# Altium project tracker-pro-airbnb-v1.0.PrjPcb (part 1 of 6)
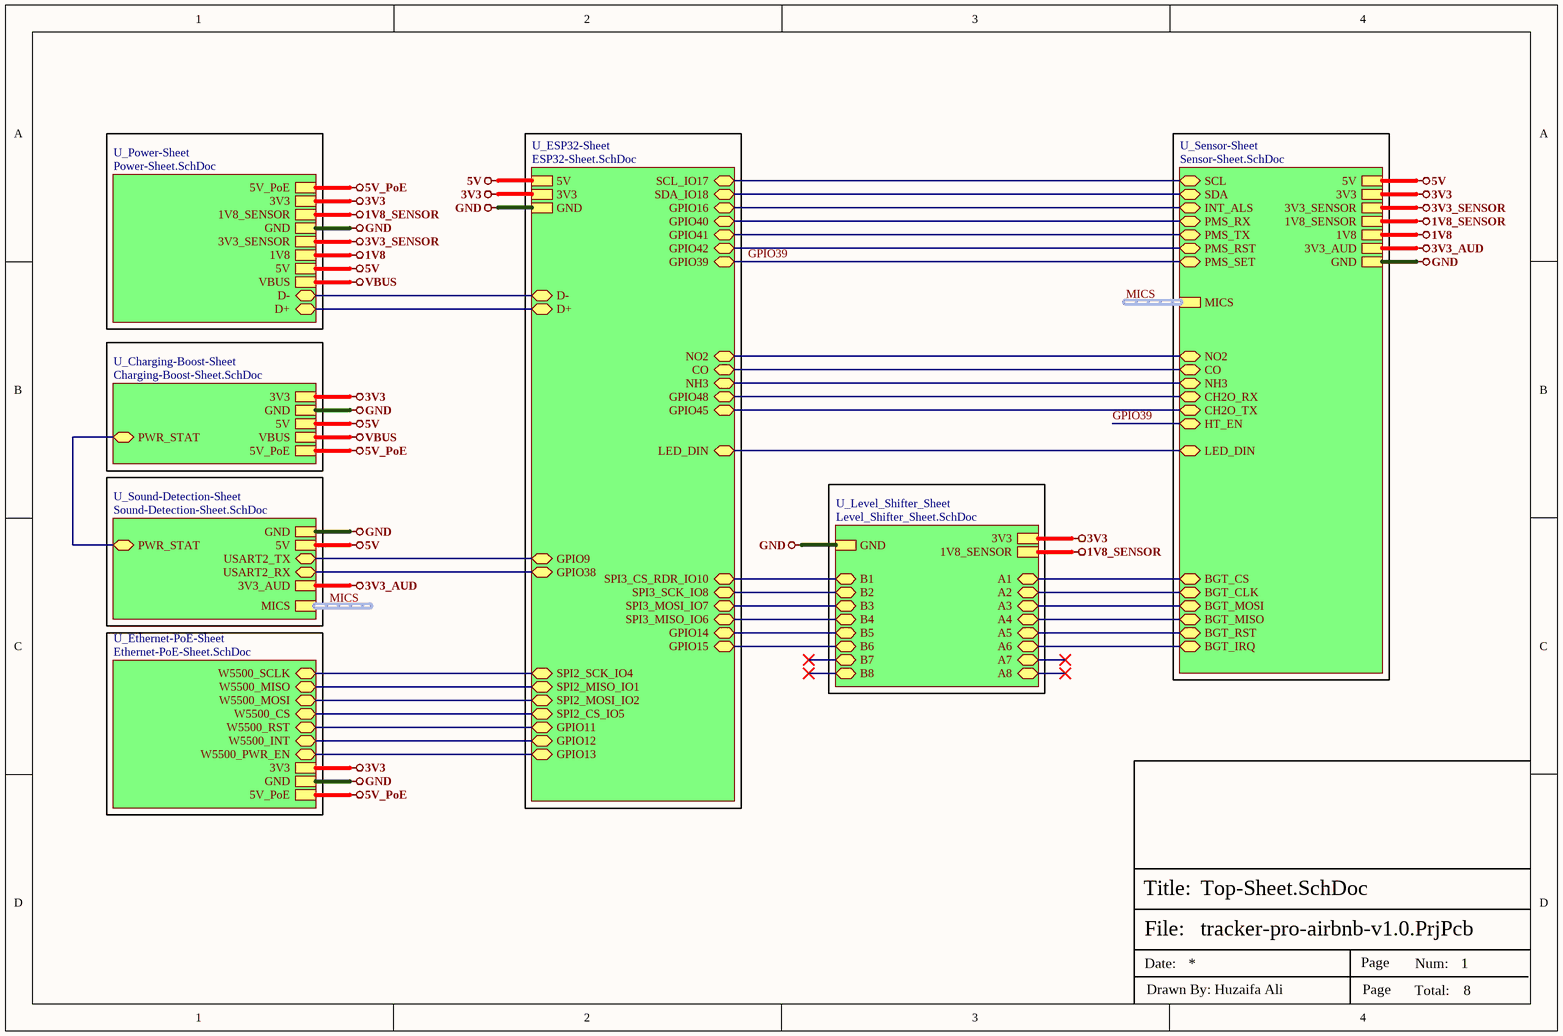
[diagram p0: Top-Sheet.SchDoc]
8 sheets, 240 parts. Net scope: hierarchical (ports join the sheet entries above them; power ports are global).
Board file: AirBnB-v1.0.PcbDoc
Sheets:
  Top-Sheet.SchDoc
    U_Power-Sheet = Power-Sheet.SchDoc
    U_Charging-Boost-Sheet = Charging-Boost-Sheet.SchDoc
    U_Sensor-Sheet = Sensor-Sheet.SchDoc
    U_Level_Shifter_Sheet = Level_Shifter_Sheet.SchDoc
    U_ESP32-Sheet = ESP32-Sheet.SchDoc
    U_Ethernet-PoE-Sheet = Ethernet-PoE-Sheet.SchDoc
    U_Sound-Detection-Sheet = Sound-Detection-Sheet.SchDoc

## Sheet Top-Sheet.SchDoc
size A4; SheetNumber: 1; SheetTotal: 8

### Sub-sheets
U_Charging-Boost-Sheet = Charging-Boost-Sheet.SchDoc: 3V3, GND, 5V, VBUS, 5V_PoE, PWR_STAT (bidir)
U_ESP32-Sheet = ESP32-Sheet.SchDoc: SDA_IO18 (bidir), SCL_IO17 (bidir), D- (bidir), D+ (bidir), NO2 (bidir), CO (bidir), NH3 (bidir), GPIO39 (bidir), GPIO40 (bidir), GPIO41 (bidir), GPIO42 (bidir), GPIO14 (bidir), GPIO15 (bidir), GPIO16 (bidir), SPI3_MISO_IO6 (bidir), SPI3_MOSI_IO7 (bidir), SPI3_SCK_IO8 (bidir), SPI3_CS_RDR_IO10 (bidir), GPIO11 (bidir), GPIO12 (bidir), GPIO13 (bidir), SPI2_CS_IO5 (bidir), SPI2_SCK_IO4 (bidir), 3V3, GND, 5V, GPIO9 (bidir), SPI2_MISO_IO1 (bidir), SPI2_MOSI_IO2 (bidir), GPIO38 (bidir), GPIO45 (bidir), GPIO48 (bidir), LED_DIN (bidir)
U_Ethernet-PoE-Sheet = Ethernet-PoE-Sheet.SchDoc: W5500_SCLK (bidir), W5500_MISO (bidir), W5500_MOSI (bidir), W5500_RST (bidir), W5500_INT (bidir), W5500_CS (bidir), W5500_PWR_EN (bidir), 3V3, GND, 5V_PoE
U_Level_Shifter_Sheet = Level_Shifter_Sheet.SchDoc: 3V3, 1V8_SENSOR, GND, A1 (bidir), A2 (bidir), A3 (bidir), A4 (bidir), A5 (bidir), A6 (bidir), A7 (bidir), A8 (bidir), B1 (bidir), B2 (bidir), B3 (bidir), B4 (bidir), B5 (bidir), B6 (bidir), B7 (bidir), B8 (bidir)
U_Power-Sheet = Power-Sheet.SchDoc: 3V3, 1V8_SENSOR, GND, 3V3_SENSOR, 1V8, 5V, VBUS, D- (bidir), D+ (bidir), 5V_PoE
U_Sensor-Sheet = Sensor-Sheet.SchDoc: SDA (bidir), SCL (bidir), BGT_CS (bidir), BGT_CLK (bidir), BGT_MOSI (bidir), BGT_RST (bidir), BGT_IRQ (bidir), BGT_MISO (bidir), PMS_SET (bidir), PMS_RX (bidir), PMS_TX (bidir), PMS_RST (bidir), INT_ALS (bidir), NO2 (bidir), CO (bidir), NH3 (bidir), CH2O_RX (bidir), CH2O_TX (bidir), 3V3, 1V8_SENSOR, GND, 3V3_SENSOR, 1V8, 5V, HT_EN (bidir), MICS (harness MICS), 3V3_AUD, LED_DIN (bidir)
U_Sound-Detection-Sheet = Sound-Detection-Sheet.SchDoc: GND, 5V, USART2_TX (bidir), USART2_RX (bidir), PWR_STAT (bidir), 3V3_AUD, MICS (harness MICS)

### Nets
1V8: sheet U_Power-Sheet/1V8, sheet U_Sensor-Sheet/1V8
1V8_SENSOR: sheet U_Power-Sheet/1V8_SENSOR, sheet U_Sensor-Sheet/1V8_SENSOR, sheet U_Level_Shifter_Sheet/1V8_SENSOR
3V3: sheet U_Power-Sheet/3V3, sheet U_Charging-Boost-Sheet/3V3, sheet U_Sensor-Sheet/3V3, sheet U_Level_Shifter_Sheet/3V3, sheet U_ESP32-Sheet/3V3, sheet U_Ethernet-PoE-Sheet/3V3
3V3_AUD: sheet U_Sensor-Sheet/3V3_AUD, sheet U_Sound-Detection-Sheet/3V3_AUD
3V3_SENSOR: sheet U_Power-Sheet/3V3_SENSOR, sheet U_Sensor-Sheet/3V3_SENSOR
5V: sheet U_Power-Sheet/5V, sheet U_Charging-Boost-Sheet/5V, sheet U_Sensor-Sheet/5V, sheet U_ESP32-Sheet/5V, sheet U_Sound-Detection-Sheet/5V
5V_PoE: sheet U_Power-Sheet/5V_PoE, sheet U_Charging-Boost-Sheet/5V_PoE, sheet U_Ethernet-PoE-Sheet/5V_PoE
GND: sheet U_Power-Sheet/GND, sheet U_Charging-Boost-Sheet/GND, sheet U_Sensor-Sheet/GND, sheet U_Level_Shifter_Sheet/GND, sheet U_ESP32-Sheet/GND, sheet U_Ethernet-PoE-Sheet/GND, sheet U_Sound-Detection-Sheet/GND
VBUS: sheet U_Power-Sheet/VBUS, sheet U_Charging-Boost-Sheet/VBUS
W5500_RST: sheet U_ESP32-Sheet/GPIO11, sheet U_Ethernet-PoE-Sheet/W5500_RST
A1: sheet U_Sensor-Sheet/BGT_CS, sheet U_Level_Shifter_Sheet/A1
A2: sheet U_Sensor-Sheet/BGT_CLK, sheet U_Level_Shifter_Sheet/A2
A3: sheet U_Sensor-Sheet/BGT_MOSI, sheet U_Level_Shifter_Sheet/A3
A4: sheet U_Sensor-Sheet/BGT_MISO, sheet U_Level_Shifter_Sheet/A4
A5: sheet U_Sensor-Sheet/BGT_RST, sheet U_Level_Shifter_Sheet/A5
A6: sheet U_Sensor-Sheet/BGT_IRQ, sheet U_Level_Shifter_Sheet/A6
B1: sheet U_Level_Shifter_Sheet/B1, sheet U_ESP32-Sheet/SPI3_CS_RDR_IO10
B2: sheet U_Level_Shifter_Sheet/B2, sheet U_ESP32-Sheet/SPI3_SCK_IO8
B3: sheet U_Level_Shifter_Sheet/B3, sheet U_ESP32-Sheet/SPI3_MOSI_IO7
B4: sheet U_Level_Shifter_Sheet/B4, sheet U_ESP32-Sheet/SPI3_MISO_IO6
B5: sheet U_Level_Shifter_Sheet/B5, sheet U_ESP32-Sheet/GPIO14
B6: sheet U_Level_Shifter_Sheet/B6, sheet U_ESP32-Sheet/GPIO15
CH2O_RX: sheet U_Sensor-Sheet/CH2O_RX, sheet U_ESP32-Sheet/GPIO48
CH2O_TX: sheet U_Sensor-Sheet/CH2O_TX, sheet U_ESP32-Sheet/GPIO45
CO: sheet U_Sensor-Sheet/CO, sheet U_ESP32-Sheet/CO
GPIO9: sheet U_ESP32-Sheet/GPIO9, sheet U_Sound-Detection-Sheet/USART2_TX
GPIO12: sheet U_ESP32-Sheet/GPIO12, sheet U_Ethernet-PoE-Sheet/W5500_INT
GPIO13: sheet U_ESP32-Sheet/GPIO13, sheet U_Ethernet-PoE-Sheet/W5500_PWR_EN
GPIO16: sheet U_Sensor-Sheet/INT_ALS, sheet U_ESP32-Sheet/GPIO16
GPIO38: sheet U_ESP32-Sheet/GPIO38, sheet U_Sound-Detection-Sheet/USART2_RX
GPIO39: sheet U_Sensor-Sheet/PMS_SET, sheet U_Sensor-Sheet/HT_EN, sheet U_ESP32-Sheet/GPIO39
GPIO40: sheet U_Sensor-Sheet/PMS_RX, sheet U_ESP32-Sheet/GPIO40
GPIO41: sheet U_Sensor-Sheet/PMS_TX, sheet U_ESP32-Sheet/GPIO41
GPIO42: sheet U_Sensor-Sheet/PMS_RST, sheet U_ESP32-Sheet/GPIO42
LED_DIN: sheet U_Sensor-Sheet/LED_DIN, sheet U_ESP32-Sheet/LED_DIN
NH3: sheet U_Sensor-Sheet/NH3, sheet U_ESP32-Sheet/NH3
NO2: sheet U_Sensor-Sheet/NO2, sheet U_ESP32-Sheet/NO2
PWR_STAT: sheet U_Charging-Boost-Sheet/PWR_STAT, sheet U_Sound-Detection-Sheet/PWR_STAT
SCL: sheet U_Sensor-Sheet/SCL, sheet U_ESP32-Sheet/SCL_IO17
SDA: sheet U_Sensor-Sheet/SDA, sheet U_ESP32-Sheet/SDA_IO18
SPI2_CS_IO5: sheet U_ESP32-Sheet/SPI2_CS_IO5, sheet U_Ethernet-PoE-Sheet/W5500_CS
SPI2_MISO_IO1: sheet U_ESP32-Sheet/SPI2_MISO_IO1, sheet U_Ethernet-PoE-Sheet/W5500_MISO
SPI2_MOSI_IO2: sheet U_ESP32-Sheet/SPI2_MOSI_IO2, sheet U_Ethernet-PoE-Sheet/W5500_MOSI
SPI2_SCK_IO4: sheet U_ESP32-Sheet/SPI2_SCK_IO4, sheet U_Ethernet-PoE-Sheet/W5500_SCLK
USB_N: sheet U_Power-Sheet/D-, sheet U_ESP32-Sheet/D-
USB_P: sheet U_Power-Sheet/D+, sheet U_ESP32-Sheet/D+

### Buses and harness runs
harness MICS = sheet U_Sensor-Sheet/MICS
harness MICS = sheet U_Sound-Detection-Sheet/MICS

### Notes on the sheet
- File:
- Title:
- Date:
- Page
- Num:
- Total:
- Drawn By: Huzaifa Ali

## Sheet Power-Sheet.SchDoc
size A4; SheetNumber: 2; SheetTotal: 8
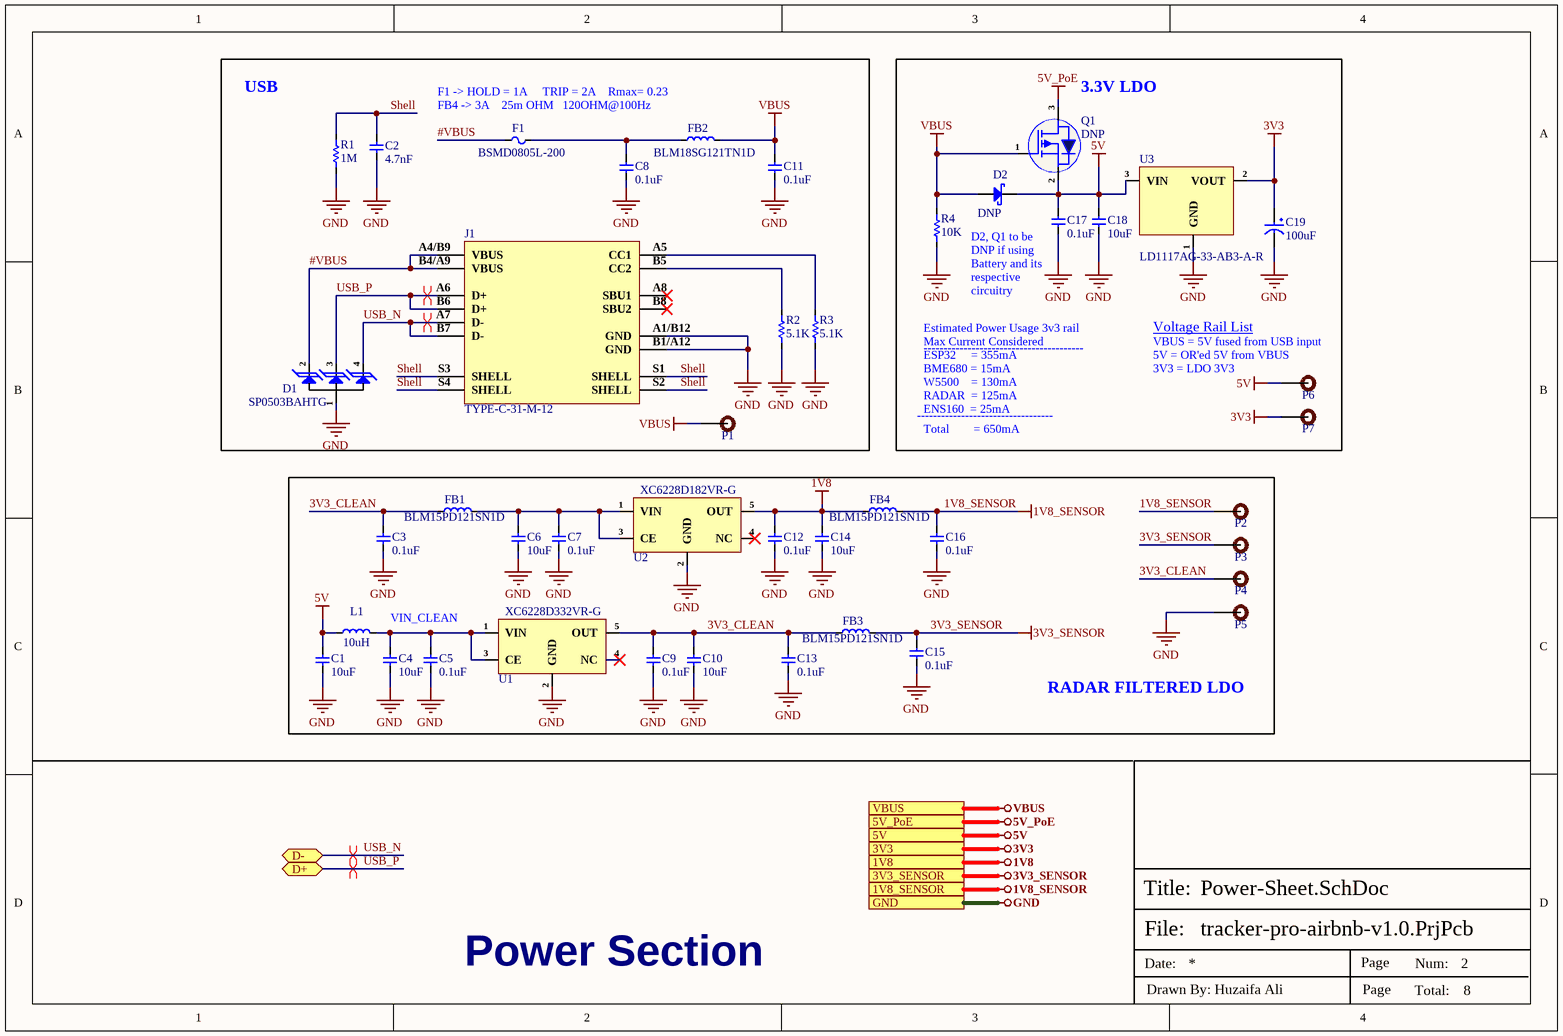
[diagram p1: Power-Sheet.SchDoc]

### Parts
C1  10uF  [Cap-0402]
C2  4.7nF  [Cap-1206]
C3  0.1uF  [Cap-0402]
C4  10uF  [Cap-0402]
C5  0.1uF  [Cap-0402]
C6  10uF  [Cap-0402]
C7  0.1uF  [Cap-0402]
C8  0.1uF  [Cap-0402]
C9  0.1uF  [Cap-0402]
C10  10uF  [Cap-0402]
C11  0.1uF  [Cap-0402]
C12  0.1uF  [Cap-0402]
C13  0.1uF  [Cap-0402]
C14  10uF  [Cap-0402]
C15  0.1uF  [Cap-0402]
C16  0.1uF  [Cap-0402]
C17  0.1uF  [Cap-0402]
C18  10uF  [Cap-0402]
C19  100uF  [Case-B]
D1  SP0503BAHTG  [SOT-143-4_]
D2  DNP  [SOD-123FL]
F1  BSMD0805L-200  [Fuse-0805]
FB1  BLM15PD121SN1D  [IND-0402]
FB2  BLM18SG121TN1D  [IND-0603 (1608 Metric)]
FB3  BLM15PD121SN1D  [IND-0402]
FB4  BLM15PD121SN1D  [IND-0402]
J1  TYPE-C-31-M-12  [TYPE-C-31-M-12_]
L1  10uH  [IND-1008 (2520 Metric)]
P1  TEST POINT  [Test-point]  (value not drawn)
P2  TEST POINT  [Test-point]  (value not drawn)
P3  TEST POINT  [Test-point]  (value not drawn)
P4  TEST POINT  [Test-point]  (value not drawn)
P5  TEST POINT  [Test-point]  (value not drawn)
P6  TEST POINT  [Test-point]  (value not drawn)
P7  TEST POINT  [Test-point]  (value not drawn)
Q1  DNP  [SOT-23]
R1  1M  [Res-0603]
R2  5.1K  [Res-0402]
R3  5.1K  [Res-0402]
R4  10K  [Res-0402]
U1  XC6228D332VR-G  [SOT-25-5]
U2  XC6228D182VR-G  [SOT-25-5]
U3  LD1117AG-33-AB3-A-R  [SOT-89-3]

### Blocks framed on the sheet
USB: C2 C8 C11 D1 F1 FB2 J1 P1 R1-R3
3.3V LDO: C17-C19 D2 P6 P7 Q1 R4 U3
RADAR FILTERED LDO: C1 C3-C7 C9 C10 C12-C16 FB1 FB3 FB4 L1 P2-P5 U1 U2

### Ports
1V8, 1V8_SENSOR, 3V3, 3V3_SENSOR, 5V, 5V_PoE, D+ (bidir), D- (bidir), GND, VBUS

### Nets
1V8: C12.2 C14.2 FB4.1 U2.5(OUT) ; port 1V8
1V8_SENSOR: C16.2 FB4.2 P2.1 ; port 1V8_SENSOR
3V3: C19.1 P7.1 U3.2(VOUT) ; port 3V3
3V3_SENSOR: C15.2 FB3.2 P3.1 ; port 3V3_SENSOR
5V: C1.2 C17.2 C18.2 D2.1(K) L1.1 P6.1 Q1.2(S) U3.3(VIN) ; port 5V
5V_PoE: Q1.3(D) ; port 5V_PoE
GND: C1.1 C2.1 C3.1 C4.1 C5.1 C6.1 C7.1 C8.1 C9.1 C10.1 C11.1 C12.1 C13.1 C14.1 C15.1 C16.1 C17.1 C18.1 C19.2 D1.1(A) J1.A1/B12(GND) J1.B1/A12(GND) P5.1 R1.1 R2.1 R3.1 R4.2 U1.2(GND) U2.2(GND) U3.1(GND) ; port GND
VBUS: C11.2 D2.2(A) FB2.2 P1.1 Q1.1(G) R4.1 ; port VBUS
3V3_CLEAN: C3.2 C9.2 C10.2 C13.2 FB1.1 FB3.1 P4.1 U1.5(OUT)
#VBUS: D1.2(K) F1.1 J1.A4/B9(VBUS) J1.B4/A9(VBUS)
Shell: C2.2 J1.S1(SHELL) J1.S2(SHELL) J1.S3(SHELL) J1.S4(SHELL) R1.2
USB_N: D1.4(K) J1.A7(D-) J1.B7(D-) ; port D-
USB_P: D1.3(K) J1.A6(D+) J1.B6(D+) ; port D+
NetC4_2: C4.2 C5.2 L1.2 U1.1(VIN) U1.3(CE)
NetC6_2: C6.2 C7.2 FB1.2 U2.1(VIN) U2.3(CE)
NetC8_2: C8.2 F1.2 FB2.1
NetJ1_A5: J1.A5(CC1) R3.2
NetJ1_B5: J1.B5(CC2) R2.2

Not connected (* = marked no-connect by the designer): J1 A8(SBU1)* B8(SBU2)*; U1 4(NC)*; U2 4(NC)*

### Layout directives
differential pair; net class USB; differential pair class USB_Lines; rule Impedance Constraint [Min = 87.00    Max = 92.00    ]; rule Matched Net Lengths [Tolerance = 0.508mm]: USB_N, USB_P

### Notes on the sheet
- F1 -> HOLD = 1A     TRIP = 2A    Rmax= 0.23
- (near F1) FB4 -> 3A    25m OHM   120OHM@100Hz
- (near C17) D2, Q1 to be DNP if using Battery and its respective circuitry
- Estimated Power Usage 3v3 rail
- Max Current Considered
- ----------------------------------------
- ESP32     = 355mA
- BME680 = 15mA
- W5500    = 130mA
- Voltage Rail List
- (near P6) VBUS = 5V fused from USB input
- (near P6) 5V = OR'ed 5V from VBUS
- 3V3 = LDO 3V3
- ----------------------------------
- RADAR  = 125mA
- Total        = 650mA
- ENS160  = 25mA
- VIN_CLEAN
- Power Section
- File:
- Title:
- Date:
- Page
- Num:
- Total:
- Drawn By: Huzaifa Ali

### Library data of the parts
C1 C4 C6 C10 C14 C18 = CC0402MRX5R6BB106: CAP CER 10UF 10V X5R 0402; Manufacturer: Yageo; Tolerance: 20%; Item Type: Capacitor; Supplier 1: Future Electronics; Manufacturer Part Number: CC0402MRX5R6BB106; RoHS: Yes; Category: Ceramic Capacitors; Stock 1: 80000; Pricing 1: 10000=0.02650, 20000=0.02590, 30000=0.02550, 40000=0.02530, 50000=0.02450 (USD); Mount: Surface Mount; Case/Package: 0402; Case Code (Imperial): 0402; Case Code (Metric): 1005; Min Operating Temperature: -55°C; Max Operating Temperature: 85°C; Packaging: Tape and Reel; Capacitance: 10uF; Voltage Rating: 10V; RoHS Compliant: Yes; ComponentLink1URL: http://www.yageo.com/documents/recent/UPY-GPHC_X5R_4V-to-50V_25.pdf?src-supplier=Digi-Key; ComponentLink1Description: http://www.yageo.com/documents/recent/UPY-GPHC_X5R_4V-to-50V_25.pdf?src-supplier=Digi-Key; Supplier Part Number 1: 6097631; LCSC Part Number: C962143
C2 = CC1206KKX7RCBB472: CAP CER 4700PF 1KV X7R 1206; Manufacturer: Yageo; Dielectric Material: Ceramic; Tolerance: 10%; Item Type: Capacitor; Supplier 1: Future Electronics; Manufacturer Part Number: CC1206KKX7RCBB472; RoHS: Yes; Category: Ceramic Capacitors; Stock 1: 180000; Pricing 1: 3000=0.02860, 9000=0.02750, 15000=0.02700, 45000=0.02600, 75000=0.02510 (USD); Mount: Surface Mount; Case/Package: 1206; Number of Pins: 2; Case Code (Imperial): 1206; Case Code (Metric): 3216; Weight: 0.000571oz; Min Operating Temperature: -55°C; Max Operating Temperature: 125°C; Voltage Rating: 1kV; Capacitance: 4.7nF; Packaging: Tape and Reel; Voltage Rating (DC): 1kV; Dielectric: X7R; Termination: SMD/SMT; Resistor Type: Ceramic; Series: CC; Length: 3.2mm; Width: 0.063inch; Thickness: 0.057inch; Depth: 1.6mm; Radiation Hardening: No; Lead Free: Lead Free; RoHS Compliant: Yes; ComponentLink1URL: https://datasheet.ciiva.com/13208/upy-gp-np0-16v-to-50v-8-13208693.pdf?src-supplier=Mouser; ComponentLink1Description: https://datasheet.ciiva.com/13208/upy-gp-np0-16v-to-50v-8-13208693.pdf?src-supplier=Mouser; ComponentLink2URL: https://datasheet.ciiva.com/11466/hv-11466701.pdf?src-supplier=Avnet; ComponentLink2Description: https://datasheet.ciiva.com/11466/hv-11466701.pdf?src-supplier=Avnet; Supplier Part Number 1: 7130131; LCSC Part Number: C107198
C3 C5 C7-C9 C11-C13 C15-C17 = C1005X5R1H104K050BB: CAP CER 0.1UF 50V X5R 0402; Manufacturer: TDK; Dielectric Material: Ceramic; Capacitance: 100nF; Tolerance: 10%; Supplier 1: Digi-Key; Manufacturer Part Number: C1005X5R1H104K050BB; Stock 1: 1455182; Pricing 1: 1=0.12, 10=0.09, 50=0.049, 100=0.04, 500=0.02858, 1000=0.02245, 2500=0.02041, 5000=0.01878 (USD); Mount: Surface Mount; Case/Package: 0402; Case Code (Metric): 1005; Case Code (Imperial): 0402; Weight: 2.3E-05oz; Min Operating Temperature: -55°C; Max Operating Temperature: 85°C; Dielectric: X5R; Voltage Rating: 50V; Packaging: Tape and Reel; Voltage Rating (DC): 50V; Termination: SMD/SMT; Construction: Flat; Package Quantity: 1; Resistor Type: Ceramic; Voltage: 50V; Series: C; Length: 1mm; Width: 0.02inch; Height: 0.5mm; Depth: 0.5mm; Thickness: 0.022inch; Radiation Hardening: No; Lead Free: Lead Free; REACH SVHC: No SVHC; RoHS Compliant: Yes; ComponentLink1URL: https://product.tdk.com/info/en/catalog/spec/mlccspec_commercial_general_midvoltage_en.pdf?src-supplier=Digi-Key; ComponentLink1Description: https://product.tdk.com/info/en/catalog/spec/mlccspec_commercial_general_midvoltage_en.pdf?src-supplier=Digi-Key; ComponentLink2URL: http://www.tdk.co.jp/tefe02/e413_c.pdf?src-supplier=Future+Electronics; ComponentLink2Description: http://www.tdk.co.jp/tefe02/e413_c.pdf?src-supplier=Future+Electronics; ComponentLink3URL: https://www.verical.com/server-webapp/html/getDatasheet?partID=743571&src-supplier=Verical; ComponentLink3Description: https://www.verical.com/server-webapp/html/getDatasheet?partID=743571&src-supplier=Verical; ComponentLink4URL: http://www.tdk.co.jp/tefe02/e412_c.pdf?src-supplier=Avnet+Europe; ComponentLink4Description: http://www.tdk.co.jp/tefe02/e412_c.pdf?src-supplier=Avnet+Europe; Supplier Part Number 1: 445-5942-1-ND; LCSC Part Number: C2181865
C19 = TAJB107M010RNJ: CAP TANT 100UF 20% 10V 1411; Manufacturer: Kyocera AVX; Dielectric Material: Tantalum; Tolerance: 10%; ESR (Equivalent Series Resistance): 1.4R; Leakage Current: 10uA; Dissipation Factor: 8%; Item Type: Capacitor; Supplier 1: Rs; Manufacturer Part Number: TAJB107M010RNJ; RoHS: Yes; Category: Tantalum Capacitors; Stock 1: 17520; Pricing 1: 2000=0.302 (GBP); Mounting Technology: Surface Mount; Case/Package: 1210; Case Code (Imperial): 1210; Case Code (Metric): 3528; Min Operating Temperature: -55°C; Max Operating Temperature: 125°C; Value: 100uF; Voltage Rating (DC): 10V; Series: TAJ; Construction: Flat; Voltage Rating: 10V; Package Quantity: 2000; Packaging: Tape and Reel; Termination: SMD/SMT; Voltage: 10V; Features: General Purpose; Length: 3.5mm; Width: 2.8mm; Height: 2.1mm; Depth: 2.8mm; Radiation Hardening: No; Lead Free: Lead Free; RoHS Compliant: Yes; Reach SVHC Compliant: No; ComponentLink1URL: https://datasheet.ciiva.com/264/taj-264281.pdf?src-supplier=Digi-Key; ComponentLink1Description: https://datasheet.ciiva.com/264/taj-264281.pdf?src-supplier=Digi-Key; ComponentLink2URL: https://datasheet.ciiva.com/264/taj-264280.pdf?src-supplier=Digi-Key; ComponentLink2Description: https://datasheet.ciiva.com/264/taj-264280.pdf?src-supplier=Digi-Key; ComponentLink3URL: https://datasheet.ciiva.com/264/taj-264282.pdf?src-supplier=Digi-Key; ComponentLink3Description: https://datasheet.ciiva.com/264/taj-264282.pdf?src-supplier=Digi-Key; ComponentLink4URL: https://datasheet.ciiva.com/11225/taj-11225964.pdf?src-supplier=Avnet; ComponentLink4Description: https://datasheet.ciiva.com/11225/taj-11225964.pdf?src-supplier=Avnet; ComponentLink5URL: https://datasheet.ciiva.com/11225/taj-11225963.pdf?src-supplier=Avnet; ComponentLink5Description: https://datasheet.ciiva.com/11225/taj-11225963.pdf?src-supplier=Avnet; Supplier Part Number 1: 1354069; LCSC Part Number: C7196
D1 = SP0503BAHTG: ESD Suppressor TVS 5.5V 4-Pin(3+Tab) SOT-143 T/R; Manufacturer: Littelfuse; Element Configuration: Common Anode; Direction: Unidirectional; Capacitance: 30pF; Number of Channels: 3; Clamping Voltage: 7.8V; Power Line Protection: No; Polarity: Bidirectional,Unidirectional; Max Power Dissipation: 225mW; ESD Protection: Yes; Max Reverse Leakage Current: 100nA; Voltage Rating (DC): 5V; Diode Type: Avalanche; Clamping Voltage-Max: 8V; Supplier 1: Digi-Key; Manufacturer Part Number: SP0503BAHTG; RoHS: Yes; Category: Diodes; Stock 1: 651; Pricing 1: 1=0.92000, 10=0.81200, 100=0.62260, 500=0.49214, 1000=0.39371 (USD); Mount: Surface Mount; Case/Package: SOT-143; Number of Pins: 4; Min Operating Temperature: -40°C; Max Operating Temperature: 85°C; Operating Supply Voltage: 5.5V; Packaging: Tape and Reel; Number of Unidirectional Channels: 3; Reverse Standoff Voltage: 5.5V; Breakdown Voltage: 5.5V; Termination: SMD/SMT; Working Voltage: 5.5V; Peak Pulse Power: 225mW; Leakage Current: 100nA; Number of Elements: 3; Power Dissipation: 225mW; Resistor Type: Zener; Series: SP05, SPA®; Length: 3.04mm; Width: 1.4mm; Height: 1.05mm; Depth: 1.4mm; Radiation Hardening: No; REACH SVHC: No SVHC; Lead Free: Lead Free; RoHS Compliant: Yes; ComponentLink1URL: https://datasheet.ciiva.com/15143/getdatasheetpartid-116020-15143550.pdf?src-supplier=Verical; ComponentLink1Description: https://datasheet.ciiva.com/15143/getdatasheetpartid-116020-15143550.pdf?src-supplier=Verical; ComponentLink2URL: https://datasheet.ciiva.com/332/sp05xxba-332550.pdf?src-supplier=Digi-Key; ComponentLink2Description: https://datasheet.ciiva.com/332/sp05xxba-332550.pdf?src-supplier=Digi-Key; ComponentLink3URL: https://datasheet.ciiva.com/8062/littefuse-spa-sp050x-8062422.pdf?src-supplier=Element14; ComponentLink3Description: https://datasheet.ciiva.com/8062/littefuse-spa-sp050x-8062422.pdf?src-supplier=Element14; ComponentLink4URL: https://datasheet.ciiva.com/22697/1911798-22697942.pdf?src-supplier=Element14; ComponentLink4Description: https://datasheet.ciiva.com/22697/1911798-22697942.pdf?src-supplier=Element14; ComponentLink5URL: https://datasheet.ciiva.com/332/sp05xxba-332551.pdf?src-supplier=Digi-Key; ComponentLink5Description: https://datasheet.ciiva.com/332/sp05xxba-332551.pdf?src-supplier=Digi-Key; ComponentLink6URL: https://datasheet.ciiva.com/16449/sp05xxba-16449463.pdf?src-supplier=Future+Electronics; ComponentLink6Description: https://datasheet.ciiva.com/16449/sp05xxba-16449463.pdf?src-supplier=Future+Electronics; ComponentLink7URL: https://datasheet.ciiva.com/332/sp05xxba-332552.pdf?src-supplier=Digi-Key; ComponentLink7Description: https://datasheet.ciiva.com/332/sp05xxba-332552.pdf?src-supplier=Digi-Key; ComponentLink8URL: https://datasheet.ciiva.com/4509/sp05x-leadfree-4509162.pdf?src-supplier=Mouser; ComponentLink8Description: https://datasheet.ciiva.com/4509/sp05x-leadfree-4509162.pdf?src-supplier=Mouser; ComponentLink9URL: https://datasheet.ciiva.com/7650/526672-7650894.pdf?src-supplier=Element14; ComponentLink9Description: https://datasheet.ciiva.com/7650/526672-7650894.pdf?src-supplier=Element14; Supplier Part Number 1: F2715CT-ND; LCSC Part Number: C3029025
D2 = PMEG4030ER: SOD-123FL Schottky Barrier Diodes (SBD) ROHS; Manufacturer: Shikues; Item Type: Diode; Manufacturer Part Number: PMEG4030ER; Package: SOD-123FL; LCSC Part Number: C5366303; ComponentLink1Description: LCSC; ComponentLink1URL: https://www.lcsc.com/product-detail/Schottky-Barrier-Diodes-SBD_Shikues-PMEG4030ER_C5366303.html
F1 = BSMD0805L-200: 6V 2A 50A 1W -40℃~+85℃ 4A 4mΩ 5s 45mΩ 0805 Resettable Fuses ROHS; Manufacturer: BHFUSE; Item Type: Fuse; Manufacturer Part Number: BSMD0805L-200; Package: 0805; LCSC Part Number: C2757931; ComponentLink1Description: LCSC; ComponentLink1URL: https://www.lcsc.com/product-detail/Resettable-Fuses_BHFUSE-BSMD0805L-200_C2757931.html
FB1 FB3 FB4 = BLM15PD121SN1D: FERRITE BEAD 120 OHM 0402 1LN; Manufacturer: Murata; Material: Steel,Ferrite; Tolerance: 25%; Impedance: 120R; Current Rating: 1.3A; Number of Lines: 1; DC Resistance (DCR): 90mR; Test Frequency: 100MHz; Supplier 1: Avnet; Manufacturer Part Number: BLM15PD121SN1D; RoHS: Yes; Category: Ferrite Beads and Chips; Stock 1: 300000; Pricing 1: 10000=0.03238, 20000=0.03063, 40000=0.02888, 60000=0.02713, 80000=0.02538, 100000=0.02363, 1000000=0.02188 (USD); Case/Package: 0402; Number of Pins: 2; Core Material: Ferrite; Case Code (Metric): 1005; Case Code (Imperial): 0402; Min Operating Temperature: -55°C; Max Operating Temperature: 125°C; Package Quantity: 1; Packaging: Tape and Reel; Max Current Rating: 1.3A; Termination: SMD/SMT; Max DC Current: 1.3A; DC Current: 1.3A; Number of Circuits: 1; Series: BLM15PD; DC Resistance-Max: 90mR; Length: 1mm; Width: 0.5mm; Height: 0.5mm; Depth: 0.55mm; Radiation Hardening: No; Reach SVHC Compliant: Yes; Military Standard: Not; Lead Free: Lead Free; RoHS Compliant: Yes; ComponentLink1URL: https://datasheet.ciiva.com/11800/0900766b811b5866-11800860.pdf?src-supplier=RSComponents; ComponentLink1Description: https://datasheet.ciiva.com/11800/0900766b811b5866-11800860.pdf?src-supplier=RSComponents; ComponentLink2URL: https://datasheet.ciiva.com/18093/getdatasheetpartid-195858-18093157.pdf?src-supplier=Verical; ComponentLink2Description: https://datasheet.ciiva.com/18093/getdatasheetpartid-195858-18093157.pdf?src-supplier=Verical; ComponentLink3URL: https://datasheet.ciiva.com/41425/001171686-da-01-en-chip-drossel0402-120r-1300ma-1-0x0-5mm-41425776.pdf?src-supplier=Conrad; ComponentLink3Description: https://datasheet.ciiva.com/41425/001171686-da-01-en-chip-drossel0402-120r-1300ma-1-0x0-5mm-41425776.pdf?src-supplier=Conrad; ComponentLink4URL: https://datasheet.ciiva.com/41449/001172205-da-01-en-drossel-0402-120r-11-0x0-5mm-10000st-41449495.pdf?src-supplier=Conrad; ComponentLink4Description: https://datasheet.ciiva.com/41449/001172205-da-01-en-drossel-0402-120r-11-0x0-5mm-10000st-41449495.pdf?src-supplier=Conrad; ComponentLink5URL: https://datasheet.ciiva.com/1012/l0110e-1012435.pdf?src-supplier=Digi-Key; ComponentLink5Description: https://datasheet.ciiva.com/1012/l0110e-1012435.pdf?src-supplier=Digi-Key; ComponentLink6URL: https://datasheet.ciiva.com/1012/l0110e-1012434.pdf?src-supplier=Digi-Key; ComponentLink6Description: https://datasheet.ciiva.com/1012/l0110e-1012434.pdf?src-supplier=Digi-Key; ComponentLink7URL: https://datasheet.ciiva.com/1012/l0110e-1012436.pdf?src-supplier=Digi-Key; ComponentLink7Description: https://datasheet.ciiva.com/1012/l0110e-1012436.pdf?src-supplier=Digi-Key; Supplier Part Number 1: BLM15PD121SN1D; LCSC Part Number: C76891; Item Type: Ferrite Bead
FB2 = BLM18SG121TN1D: FERRITE BEAD 120 OHM 0603 1LN; Manufacturer: Murata; Material: Steel,Ferrite; Tolerance: 25%; Impedance: 120R; DC Resistance (DCR): 25mR; Max DC Current: 3A; Number of Lines: 1; Test Frequency: 100MHz; Shielding: Unshielded; Supplier 1: Arrow Electronics; Manufacturer Part Number: BLM18SG121TN1D; RoHS: Yes; Category: Ferrite Beads and Chips; Stock 1: 82612; Pricing 1: 1=0.12640, 10=0.08350, 25=0.07210, 100=0.05150, 250=0.04730, 500=0.04110, 1000=0.03420, 3000=0.03360, 6000=0.03320, 15000=0.03270, 30000=0.03200, 75000=0.03150 (USD); Case/Package: 0603; Number of Pins: 2; Core Material: Ferrite; Case Code (Metric): 1608; Case Code (Imperial): 0603; Min Operating Temperature: -55°C; Max Operating Temperature: 125°C; Package Quantity: 1; Max Current Rating: 3A; Packaging: Tape and Reel; Current Rating: 3A; Termination: SMD/SMT; Frequency: 100MHz; Number of Circuits: 1; Series: BLM18S; DC Resistance-Max: 25mR; Length: 1.6mm; Width: 0.8mm; Height: 0.8mm; Depth: 0.8mm; Reach SVHC Compliant: Yes; Lead Free: Lead Free; RoHS Compliant: Yes; ComponentLink1URL: https://datasheet.ciiva.com/1012/l0110s0100blm18s-1012624.pdf?src-supplier=Digi-Key; ComponentLink1Description: https://datasheet.ciiva.com/1012/l0110s0100blm18s-1012624.pdf?src-supplier=Digi-Key; ComponentLink2URL: https://datasheet.ciiva.com/11799/0900766b811b5866-11799181.pdf?src-supplier=RSComponents; ComponentLink2Description: https://datasheet.ciiva.com/11799/0900766b811b5866-11799181.pdf?src-supplier=RSComponents; ComponentLink3URL: https://datasheet.ciiva.com/18093/getdatasheetpartid-295885-18093249.pdf?src-supplier=Verical; ComponentLink3Description: https://datasheet.ciiva.com/18093/getdatasheetpartid-295885-18093249.pdf?src-supplier=Verical; ComponentLink4URL: https://datasheet.ciiva.com/41449/001171723-da-01-en-chip-drossel0603-120r-3000ma-1-6x0-8mm-41449353.pdf?src-supplier=Conrad; ComponentLink4Description: https://datasheet.ciiva.com/41449/001171723-da-01-en-chip-drossel0603-120r-3000ma-1-6x0-8mm-41449353.pdf?src-supplier=Conrad; ComponentLink5URL: https://datasheet.ciiva.com/41449/001172312-da-01-en-drossel-0603-120r-1-6x0-8mm-10000st-41449675.pdf?src-supplier=Conrad; ComponentLink5Description: https://datasheet.ciiva.com/41449/001172312-da-01-en-drossel-0603-120r-1-6x0-8mm-10000st-41449675.pdf?src-supplier=Conrad; ComponentLink6URL: https://datasheet.ciiva.com/8021/5151-8021511.pdf?src-supplier=Element14; ComponentLink6Description: https://datasheet.ciiva.com/8021/5151-8021511.pdf?src-supplier=Element14; ComponentLink7URL: https://datasheet.ciiva.com/8021/5151-8021512.pdf?src-supplier=Element14; ComponentLink7Description: https://datasheet.ciiva.com/8021/5151-8021512.pdf?src-supplier=Element14; ComponentLink8URL: https://datasheet.ciiva.com/14122/blm-series-eng-tds-14122906.pdf?src-supplier=Distrelec; ComponentLink8Description: https://datasheet.ciiva.com/14122/blm-series-eng-tds-14122906.pdf?src-supplier=Distrelec; ComponentLink9URL: https://datasheet.ciiva.com/1012/l0110s0100blm18s-1012623.pdf?src-supplier=Digi-Key; ComponentLink9Description: https://datasheet.ciiva.com/1012/l0110s0100blm18s-1012623.pdf?src-supplier=Digi-Key; ComponentLink10URL: https://datasheet.ciiva.com/1012/l0110s0100blm18s-1012625.pdf?src-supplier=Digi-Key; ComponentLink10Description: https://datasheet.ciiva.com/1012/l0110s0100blm18s-1012625.pdf?src-supplier=Digi-Key; ComponentLink11URL: https://datasheet.ciiva.com/16395/l0110s0100blm18s-16395498.pdf?src-supplier=Future+Electronics; ComponentLink11Description: https://datasheet.ciiva.com/16395/l0110s0100blm18s-16395498.pdf?src-supplier=Future+Electronics; Supplier Part Number 1: BLM18SG121TN1D; LCSC Part Number: C113030; Item Type: Ferrite Bead
J1 = TYPE-C-31-M-12: 250mA 1 16 Female Type-C SMD USB Connectors ROHS; Manufacturer: Korean Hroparts Elec; ComponentLink1Description: LCSC; ComponentLink1URL: https://www.lcsc.com/product-detail/USB-Connectors_Korean-Hroparts-Elec-TYPE-C-31-M-12_C165948.html; Manufacturer Part Number: TYPE-C-31-M-12; Footprint: Custom; LCSC Part Number: C165948; Item Type: USB Connector
L1 = VLS252012HBX-100M-1: FIXED IND 10UH 1A 540 MOHM SMD; Manufacturer: TDK; Core Material: Metal; Saturation Current: 850mA; Shielding: Shielded; DC Resistance (DCR): 540mR; Test Frequency: 1MHz; Tolerance: 20%; Item Type: Inductor; Supplier 1: Arrow Electronics; Manufacturer Part Number: VLS252012HBX-100M-1; RoHS: Yes; Category: Fixed Inductors; Stock 1: 10000; Pricing 1: 2000=0.12770, 24000=0.12640 (USD); Mount: Surface Mount; Case/Package: 1008; Case Code (Metric): 2520; Case Code (Imperial): 1008; Min Operating Temperature: -40°C; Max Operating Temperature: 105°C; Packaging: Cut Tape; Resistor Type: Wirewound; Inductance: 10uH; Current Rating: 1A; RMS Current (Irms): 1A; Inductance Tolerance: 20%; Series: VLS-HBX-1; Length: 0.098inch; Width: 0.079inch; Height - Seated (Max): 0.047inch; Reach SVHC Compliant: Yes; RoHS Compliant: Yes; ComponentLink1URL: http://www.farnell.com/datasheets/1866267.pdf?src-supplier=Farnell; ComponentLink1Description: http://www.farnell.com/datasheets/1866267.pdf?src-supplier=Farnell; ComponentLink2URL: http://www.farnell.com/datasheets/2608160.pdf?src-supplier=Farnell; ComponentLink2Description: http://www.farnell.com/datasheets/2608160.pdf?src-supplier=Farnell; ComponentLink3URL: http://www.farnell.com/datasheets/2130011.pdf?src-supplier=Element14; ComponentLink3Description: http://www.farnell.com/datasheets/2130011.pdf?src-supplier=Element14; ComponentLink4URL: http://www.farnell.com/datasheets/1866267.pdf?src-supplier=Newark; ComponentLink4Description: http://www.farnell.com/datasheets/1866267.pdf?src-supplier=Newark; ComponentLink5URL: https://product.tdk.com/info/en/catalog/datasheets/inductor_commercial_power_vls252012hbx-1_en.pdf?src-supplier=Digi-Key; ComponentLink5Description: https://product.tdk.com/info/en/catalog/datasheets/inductor_commercial_power_vls252012hbx-1_en.pdf?src-supplier=Digi-Key; ComponentLink6URL: https://product.tdk.com/info/en/catalog/datasheets/inductor_commercial_power_vls252012hbx-1_en.pdf?ref_disty=digikey&src-supplier=Digi-Key; ComponentLink6Description: https://product.tdk.com/info/en/catalog/datasheets/inductor_commercial_power_vls252012hbx-1_en.pdf?ref_disty=digikey&src-supplier=Digi-Key; Supplier Part Number 1: VLS252012HBX-100M-1; LCSC Part Number: C88532
P1-P7 = TEST POINT: Test Point ON; Item Type: TEST POINT
Q1 = SI2323DS: SOT-23-3 MOSFETs ROHS; Manufacturer: TECH PUBLIC; Item Type: Mosfet; Manufacturer Part Number: SI2323DS; Package: SOT-23-3; LCSC Part Number: C5182044; ComponentLink1Description: LCSC; ComponentLink1URL: https://www.lcsc.com/product-detail/MOSFETs_TECH-PUBLIC-SI2323DS_C5182044.html
R1 = RC0603FR-071ML: RES SMD 1M OHM 1% 1/10W 0603; Manufacturer: Yageo; Voltage Rating: 50V; Resistance: 1MR; Power Rating: 100mW; Temperature Coefficient: 100ppm/°C; Supplier 1: Digi-Key; Manufacturer Part Number: RC0603FR-071ML; Stock 1: 3824601; Pricing 1: 1=0.1, 10=0.023, 100=0.0094, 1000=0.00421, 2500=0.00366 (USD); Case/Package: 0603; Number of Pins: 2; Case Code (Imperial): 0603; Case Code (Metric): 1608; Min Operating Temperature: -55°C; Max Operating Temperature: 155°C; Voltage Rating (DC): 50V; Tolerance: 1%; Packaging: Tape and Reel; Package Quantity: 5000; Termination: SMD/SMT; Composition: Thick Film; Military Standard: Not; Length: 1.6mm; Height: 0.45mm; Width: 0.8mm; Depth: 0.8mm; REACH SVHC: No SVHC; Lead Free: Lead Free; ComponentLink1URL: http://www.farnell.com/datasheets/2167052.pdf?src-supplier=Mouser; ComponentLink1Description: http://www.farnell.com/datasheets/2167052.pdf?src-supplier=Mouser; ComponentLink2URL: http://www.farnell.com/datasheets/2167052.pdf?src-supplier=Element14; ComponentLink2Description: http://www.farnell.com/datasheets/2167052.pdf?src-supplier=Element14; ComponentLink3URL: http://documents.rs-components.com/techlib://itc_doclist_GB.htm?stockno=5048956&src-supplier=RSComponents; ComponentLink3Description: http://documents.rs-components.com/techlib://itc_doclist_GB.htm?stockno=5048956&src-supplier=RSComponents; Supplier Part Number 1: 311-1.00MHRDKR-ND; LCSC Part Number: C105578
R2 R3 = RC0402FR-075K1L: RES 5.1K OHM 1% 1/16W 0402; Manufacturer: Yageo; Power Rating: 63mW; Resistance: 5.1kR; Temperature Coefficient: 100ppm/°C; Voltage Rating: 50V; Item Type: Resistor; Supplier 1: Avnet; Manufacturer Part Number: RC0402FR-075K1L; RoHS: Yes; Category: Chip SMD Resistors; Stock 1: 65000; Pricing 1: 10000=0.00085 (USD); Case/Package: 0402; Case Code (Metric): 1005; Case Code (Imperial): 0402; Min Operating Temperature: -55°C; Max Operating Temperature: 155°C; Tolerance: 1%; Technology: THICK FILM; Packaging: Tape and Reel; Package Quantity: 1; Resistor Type: Thick Film; Number of Terminations: 2; Termination: SMD/SMT; Max Power Dissipation: 63mW; Voltage Rating (DC): 50V; Working Voltage: 50V; Features: Moisture Resistant; Series: RC; Resistance Tolerance: 1%; Construction: Rectangular; Length: 1mm; Width: 0.02inch; Height: 0.016inch; Depth: 0.5mm; RoHS Compliant: Yes; Military Standard: Not; Lead Free: Lead Free; ComponentLink1URL: https://datasheet.ciiva.com/7983/1018594-7983519.pdf?src-supplier=Element14; ComponentLink1Description: https://datasheet.ciiva.com/7983/1018594-7983519.pdf?src-supplier=Element14; ComponentLink2URL: https://datasheet.ciiva.com/46394/1018594-46394936.pdf?src-supplier=Element14; ComponentLink2Description: https://datasheet.ciiva.com/46394/1018594-46394936.pdf?src-supplier=Element14; ComponentLink3URL: https://datasheet.ciiva.com/2453/pyu-r-int-thick-7-2453401.pdf?src-supplier=Digi-Key; ComponentLink3Description: https://datasheet.ciiva.com/2453/pyu-r-int-thick-7-2453401.pdf?src-supplier=Digi-Key; ComponentLink4URL: https://datasheet.ciiva.com/2453/pyu-r-int-thick-7-2453402.pdf?src-supplier=Digi-Key; ComponentLink4Description: https://datasheet.ciiva.com/2453/pyu-r-int-thick-7-2453402.pdf?src-supplier=Digi-Key; ComponentLink5URL: https://datasheet.ciiva.com/2453/pyu-r-int-thick-7-2453400.pdf?src-supplier=Digi-Key; ComponentLink5Description: https://datasheet.ciiva.com/2453/pyu-r-int-thick-7-2453400.pdf?src-supplier=Digi-Key; ComponentLink6URL: https://datasheet.ciiva.com/12558/pyu-rc0402-51-rohs-l-6-r-8721-12558460.pdf?src-supplier=Mouser; ComponentLink6Description: https://datasheet.ciiva.com/12558/pyu-rc0402-51-rohs-l-6-r-8721-12558460.pdf?src-supplier=Mouser; ComponentLink7URL: https://datasheet.ciiva.com/16744/pyu-rc0402-51-rohs-l-6-r-16744283.pdf?src-supplier=Future+Electronics; ComponentLink7Description: https://datasheet.ciiva.com/16744/pyu-rc0402-51-rohs-l-6-r-16744283.pdf?src-supplier=Future+Electronics; ComponentLink8URL: https://datasheet.ciiva.com/15189/getdatasheetpartid-323636-15189493.pdf?src-supplier=Verical; ComponentLink8Description: https://datasheet.ciiva.com/15189/getdatasheetpartid-323636-15189493.pdf?src-supplier=Verical; Supplier Part Number 1: RC0402FR-075K1L; LCSC Part Number: C137973
R4 = RC0402FR-0710KL: RES 10K OHM 1% 1/16W 0402; Manufacturer: Yageo; Resistance: 10kR; Voltage Rating (DC): 50V; Temperature Coefficient: 100ppm/°C; Power Rating: 62.5mW; Max Power Dissipation: 63mW; Item Type: Resistor; Supplier 1: Mouser; Manufacturer Part Number: RC0402FR-0710KL; RoHS: Yes; Category: Chip SMD Resistors; Stock 1: 18648329; Pricing 1: 1=0.10000, 10=0.01400, 50=0.01400, 100=0.00500, 1000=0.00300, 10000=0.00200 (USD); Case/Package: 0402; Number of Pins: 2; Case Code (Imperial): 0402; Case Code (Metric): 1005; Min Operating Temperature: -55°C; Max Operating Temperature: 155°C; Resistor Type: Thick Film; Tolerance: 1%; Packaging: Tape and Reel; Voltage Rating: 50V; Termination: SMD/SMT; Working Voltage: 50V; Number of Terminations: 2; Features: Moisture Resistant; Series: RC; Resistance Tolerance: 1%; Construction: Rectangular; Length: 1mm; Width: 0.5mm; Height: 0.32mm; Depth: 0.5mm; Lead Pitch: 0.2mm; REACH SVHC: No SVHC; Lead Free: Lead Free; RoHS Compliant: Yes; Military Standard: Not; ComponentLink1URL: https://datasheet.ciiva.com/7660/38568-7660787.pdf?src-supplier=Element14; ComponentLink1Description: https://datasheet.ciiva.com/7660/38568-7660787.pdf?src-supplier=Element14; ComponentLink2URL: https://datasheet.ciiva.com/7849/1686128-7849814.pdf?src-supplier=Element14; ComponentLink2Description: https://datasheet.ciiva.com/7849/1686128-7849814.pdf?src-supplier=Element14; ComponentLink3URL: https://datasheet.ciiva.com/7983/1018594-7983486.pdf?src-supplier=Element14; ComponentLink3Description: https://datasheet.ciiva.com/7983/1018594-7983486.pdf?src-supplier=Element14; ComponentLink4URL: https://datasheet.ciiva.com/22747/1018594-22747512.pdf?src-supplier=Element14; ComponentLink4Description: https://datasheet.ciiva.com/22747/1018594-22747512.pdf?src-supplier=Element14; ComponentLink5URL: https://datasheet.ciiva.com/12667/pyu-rc0402-51-rohs-l-6-r-12667067.pdf?src-supplier=Mouser; ComponentLink5Description: https://datasheet.ciiva.com/12667/pyu-rc0402-51-rohs-l-6-r-12667067.pdf?src-supplier=Mouser; ComponentLink6URL: https://datasheet.ciiva.com/7849/1784430-7849813.pdf?src-supplier=Element14; ComponentLink6Description: https://datasheet.ciiva.com/7849/1784430-7849813.pdf?src-supplier=Element14; ComponentLink7URL: https://datasheet.ciiva.com/7849/1784430-7849815.pdf?src-supplier=Element14; ComponentLink7Description: https://datasheet.ciiva.com/7849/1784430-7849815.pdf?src-supplier=Element14; Supplier Part Number 1: 603-RC0402FR-0710KL; LCSC Part Number: C60490
U1 = XC6228D332VR-G: 300mA 80dB@(1kHz) 305mV@(300mA) Fixed 3.3V~3.3V Positive 1 5.5V SOT-25-5 Linear Voltage Regulators (LDO) ROHS; Manufacturer: Torex Semicon; Item Type: IC; Manufacturer Part Number: XC6228D332VR-G; Package: SOT-25-5; LCSC Part Number: C69841; ComponentLink1Description: LCSC; ComponentLink1URL: https://www.lcsc.com/product-detail/Linear-Voltage-Regulators-LDO_Torex-Semicon-XC6228D332VR-G_C69841.html
U2 = XC6228D182VR-G: 300mA 80dB@(1kHz) 410mV@(300mA) Fixed 1.8V~1.8V Positive 1 5.5V SOT-25-5 Linear Voltage Regulators (LDO) ROHS; Manufacturer: Torex Semicon; Item Type: IC; Manufacturer Part Number: XC6228D182VR-G; Package: SOT-25-5; LCSC Part Number: C216644; ComponentLink1Description: LCSC; ComponentLink1URL: https://www.lcsc.com/product-detail/Linear-Voltage-Regulators-LDO_Torex-Semicon-XC6228D182VR-G_C216644.html
U3 = LD1117AG-33-AB3-A-R: 75dB@(120Hz) 1A Fixed 3.3V~3.3V Positive 15V SOT-89-3 Linear Voltage Regulators (LDO) ROHS; Manufacturer: UTC; Item Type: IC; Manufacturer Part Number: LD1117AG-33-AB3-A-R; Package: SOT-89-3; LCSC Part Number: C81768; ComponentLink1Description: LCSC; ComponentLink1URL: https://www.lcsc.com/product-detail/Linear-Voltage-Regulators-LDO_UTC-Unisonic-Tech-LD1117AG-33-AB3-A-R_C81768.html